# Altium project Light_Shield_V1.0.PrjPcb
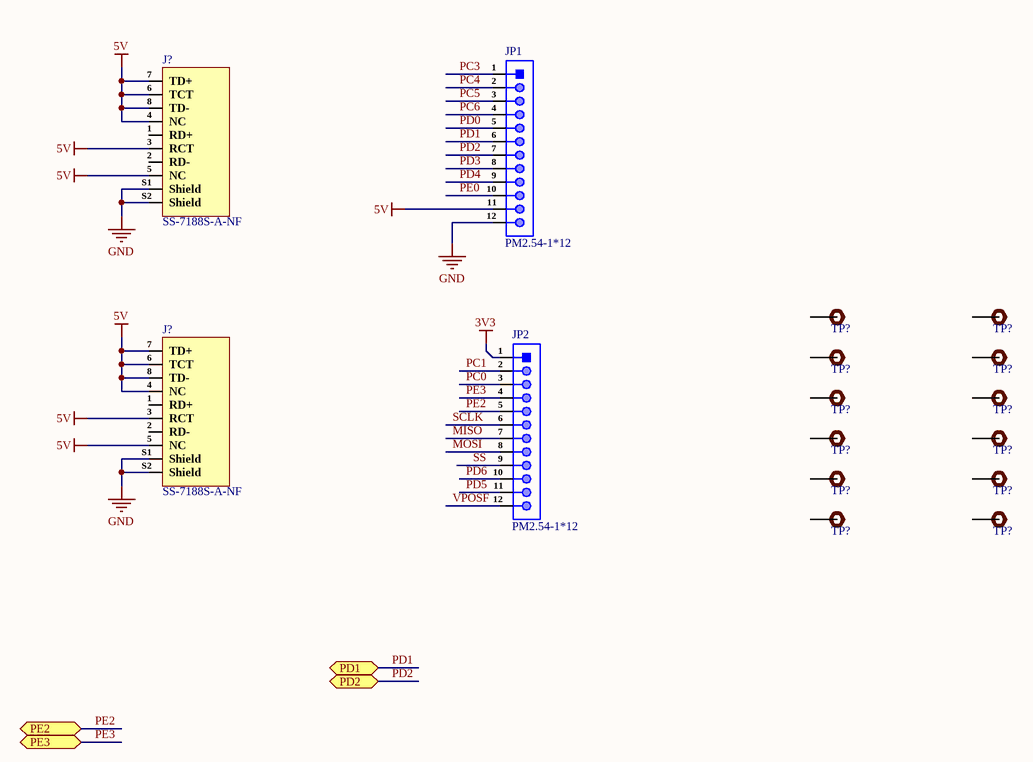
[diagram p0: Sheet1.SchDoc]
2 sheets, 22 parts. Net scope: flat (ports and power ports of the same name join across sheets).
Sheets:
  Sheet1.SchDoc
  Sheet2.SchDoc

## Sheet Sheet1.SchDoc
size A4; SheetNumber: 1; SheetTotal: 2

### Parts
(Parts that share a designator on the sheet are numbered #1, #2 ... from top to bottom, then left to right.)
J?#1  SS-7188S-A-NF  [SS-7188S-A-NF]
J?#2  SS-7188S-A-NF  [SS-7188S-A-NF]
JP1  PM2.54-1*12  [HDR 1x12 TH (Female)]
JP2  PM2.54-1*12  [HDR 1x12 TH (Female)]
TP?#1  TEST POINT  [Test-point]  (value not drawn)  (no BOM)
TP?#2  TEST POINT  [Test-point]  (value not drawn)  (no BOM)
TP?#3  TEST POINT  [Test-point]  (value not drawn)  (no BOM)
TP?#4  TEST POINT  [Test-point]  (value not drawn)  (no BOM)
TP?#5  TEST POINT  [Test-point]  (value not drawn)  (no BOM)
TP?#6  TEST POINT  [Test-point]  (value not drawn)  (no BOM)
TP?#7  TEST POINT  [Test-point]  (value not drawn)  (no BOM)
TP?#8  TEST POINT  [Test-point]  (value not drawn)  (no BOM)
TP?#9  TEST POINT  [Test-point]  (value not drawn)  (no BOM)
TP?#10  TEST POINT  [Test-point]  (value not drawn)  (no BOM)
TP?#11  TEST POINT  [Test-point]  (value not drawn)  (no BOM)
TP?#12  TEST POINT  [Test-point]  (value not drawn)  (no BOM)

### Ports
PD1 (bidir, see Sheet2[1D]), PD2 (bidir, see Sheet2[1D]), PE2 (bidir, see Sheet2[1D]), PE3 (bidir, see Sheet2[1D])

### Nets
3V3: JP2.1
5V: J?#1.3(RCT) J?#1.4(NC) J?#1.5(NC) J?#1.6(TCT) J?#1.7(TD+) J?#1.8(TD-) J?#2.3(RCT) J?#2.4(NC) J?#2.5(NC) J?#2.6(TCT) J?#2.7(TD+) J?#2.8(TD-) JP1.11
GND: J?#1.S1(Shield) J?#1.S2(Shield) J?#2.S1(Shield) J?#2.S2(Shield) JP1.12
MISO: JP2.7
MOSI: JP2.8
PC0: JP2.3
PC1: JP2.2
PC3: JP1.1
PC4: JP1.2
PC5: JP1.3
PC6: JP1.4
PD0: JP1.5
PD1: JP1.6 ; port PD1
PD2: JP1.7 ; port PD2
PD3: JP1.8
PD4: JP1.9
PD5: JP2.11
PD6: JP2.10
PE0: JP1.10
PE2: JP2.5 ; port PE2
PE3: JP2.4 ; port PE3
SCLK: JP2.6
SS: JP2.9
VPOSF: JP2.12

Not connected (* = marked no-connect by the designer): J?#1 1(RD+) 2(RD-); J?#2 1(RD+) 2(RD-); TP?#1 1; TP?#2 1; TP?#3 1; TP?#4 1; TP?#5 1; TP?#6 1; TP?#7 1; TP?#8 1; TP?#9 1; TP?#10 1; TP?#11 1; TP?#12 1

### Notes on the sheet
- File:
- Title:
- Date:
- Page
- Num:
- Total:
- Drawn By: Huzaifa Ali

### Library data of the parts
J?#1 J?#2 = SS-7188S-A-NF: CONN MOD JACK 8P8C R/A SHIELDED; Manufacturer: Bel; Item Type: Connectors; Supplier: Digikey; Supplier Part Number: 380-1047-ND; Manufacturer Part Number: SS-7188S-A-NF; RoHS: Yes; Stock: 8195; Pricing: 1=2.36, 10=2.058, 33=1.9703, 66=1.92652, 132=1.83894, 264=1.66379, 528=1.53242, 1023=1.31351, 2508=1.22594 (USD); Lead Free: 5698LeadFree; ComponentLink1URL: https://datasheet.ciiva.com/11726/0900766b8001c3e8-11726092.pdf?src-supplier=Rs; ComponentLink1Description: https://datasheet.ciiva.com/11726/0900766b8001c3e8-11726092.pdf?src-supplier=Rs; ComponentLink2URL: https://datasheet.ciiva.com/685/ct710001-685643.pdf?src-supplier=Digikey; ComponentLink2Description: https://datasheet.ciiva.com/685/ct710001-685643.pdf?src-supplier=Digikey; ComponentLink3URL: https://datasheet.ciiva.com/26934/getdatasheetpartid-781435-26934401.pdf?src-supplier=Verical; ComponentLink3Description: https://datasheet.ciiva.com/26934/getdatasheetpartid-781435-26934401.pdf?src-supplier=Verical; ComponentLink4URL: https://datasheet.ciiva.com/3138/ct710001-3138744.pdf?src-supplier=Avnet; ComponentLink4Description: https://datasheet.ciiva.com/3138/ct710001-3138744.pdf?src-supplier=Avnet; ComponentLink5URL: https://datasheet.ciiva.com/15170/getdatasheetpartid-79418-15170477.pdf?src-supplier=Verical; ComponentLink5Description: https://datasheet.ciiva.com/15170/getdatasheetpartid-79418-15170477.pdf?src-supplier=Verical
JP1 JP2 = PM2.54-1*12: 2.54mm 2.54mm Plugin 2.5A 12P -40℃~+105℃ Straight 1x12P Top 8.5mm Square Hole Plugin,P=2.54mm Female Headers ROHS; Manufacturer: ZHOURI; Manufacturer Part Number: PM2.54-1*12; Package: Plugin,P=2.54mm; LCSC Part Number: C5224029; Item Type: Female Header; ComponentLink1Description: LCSC; ComponentLink1URL: https://www.lcsc.com/product-detail/span-style-background-color-ff0-Female-span-Headers_ZHOURI-PM2-54-1-12_C5224029.html
TP?#1-TP?#12 = TEST POINT: Test Point ON; Item Type: TEST POINT

## Sheet Sheet2.SchDoc
size A4; SheetNumber: 2; SheetTotal: 2
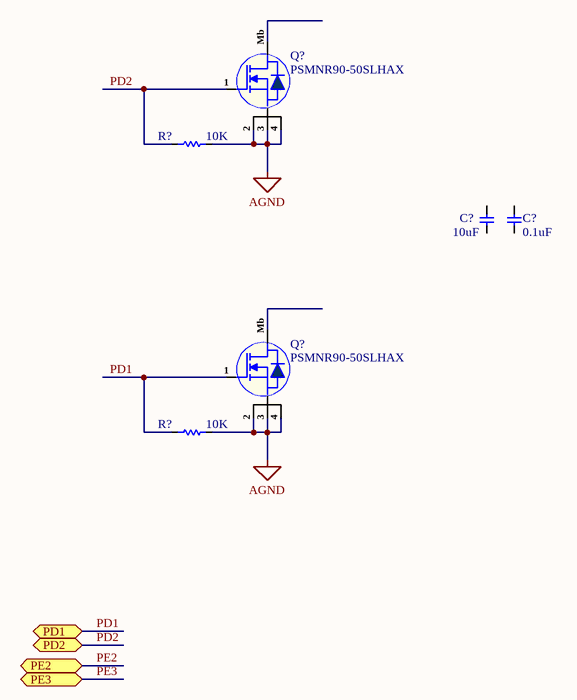
[diagram p1: Sheet2.SchDoc]

### Parts
(Parts that share a designator on the sheet are numbered #1, #2 ... from top to bottom, then left to right.)
C?#1  10uF  [Cap-0603]
C?#2  0.1uF  [Cap-0603]
Q?#1  PSMNR90-50SLHAX  [LFPAK88 (SOT1235)]
Q?#2  PSMNR90-50SLHAX  [LFPAK88 (SOT1235)]
R?#1  10K  [Res-0603]
R?#2  10K  [Res-0603]

### Ports
PD1 (bidir, see Sheet1[2C]), PD2 (bidir, see Sheet1[2D]), PE2 (bidir, see Sheet1[2D]), PE3 (bidir, see Sheet1[2D])

### Nets
AGND: Q?#1.2(S) Q?#1.3(S) Q?#1.4(S) Q?#2.2(S) Q?#2.3(S) Q?#2.4(S) R?#1.1 R?#2.1
PD1: Q?#2.1(G) R?#2.2 ; port PD1
PD2: Q?#1.1(G) R?#1.2 ; port PD2

Not connected (* = marked no-connect by the designer): C?#1 1 2; C?#2 1 2; Q?#1 Mb(D); Q?#2 Mb(D)

### Notes on the sheet
- File:
- Title:
- Date:
- Page
- Num:
- Total:
- Drawn By: Huzaifa Ali

### Library data of the parts
C?#1 = CL10A106MA8NRNC: CAP CER 10UF 25V X5R 0603; Manufacturer: Samsung; Tolerance: 20%; Supplier 1: Avnet; Manufacturer Part Number: CL10A106MA8NRNC; RoHS: Yes; Category: Ceramic Capacitors; Pricing 1: 4000=0.03753, 8000=0.03700, 16000=0.03595, 24000=0.03515, 32000=0.03383, 40000=0.03304, 400000=0.03225 (USD); Mount: Surface Mount; Case/Package: 0603; Case Code (Metric): 1608; Case Code (Imperial): 0603; Contact Plating: Tin; Min Operating Temperature: -55°C; Max Operating Temperature: 85°C; Package Quantity: 1; Packaging: Tape and Reel; Capacitance: 10uF; Voltage Rating: 25V; Dielectric: X5R; Termination: Wraparound; Series: CL; Construction: Flat; Length: 0.063inch; Width: 0.031inch; Thickness: 0.035inch; Lead Free: Lead Free; RoHS Compliant: Yes; ComponentLink1URL: https://datasheet.ciiva.com/25766/cl10a106ma8nrnc-25766562.pdf?src-supplier=Digi-Key; ComponentLink1Description: https://datasheet.ciiva.com/25766/cl10a106ma8nrnc-25766562.pdf?src-supplier=Digi-Key; Supplier Part Number 1: CL10A106MA8NRNC; LCSC Part Number: C96446
C?#2 = CL10B104KB8NNNC: CAP CER 0.1UF 50V X7R 0603; Manufacturer: Samsung; Material: Ceramic; Capacitance: 100nF; Tolerance: 10%; Supplier 1: Digi-Key; Manufacturer Part Number: CL10B104KB8NNNC; RoHS: Yes; Category: Ceramic Capacitors; Stock 1: 3998791; Pricing 1: 1=0.10000, 10=0.03000, 50=0.01640, 100=0.01340, 500=0.00954, 1000=0.00750 (USD); Mount: Surface Mount; Case/Package: 0603; Case Code (Metric): 1608; Case Code (Imperial): 0603; Contact Plating: Tin; Min Operating Temperature: -55°C; Max Operating Temperature: 125°C; Dielectric: X7R; Voltage Rating: 50V; Package Quantity: 1; Packaging: Tape and Reel; Voltage: 50V; Voltage Rating (DC): 50V; Series: CL; Construction: Flat; Length: 1.6mm; Width: 0.031inch; Height: 0.8mm; Depth: 0.8mm; Thickness: 0.035inch; Radiation Hardening: No; Lead Free: Lead Free; RoHS Compliant: Yes; ComponentLink1URL: https://datasheet.ciiva.com/25803/cl10b104kb8nnnc-25803393.pdf?src-supplier=Digi-Key; ComponentLink1Description: https://datasheet.ciiva.com/25803/cl10b104kb8nnnc-25803393.pdf?src-supplier=Digi-Key; ComponentLink2URL: https://datasheet.ciiva.com/26838/getdatasheetpartid-89097-26838411.pdf?src-supplier=Verical; ComponentLink2Description: https://datasheet.ciiva.com/26838/getdatasheetpartid-89097-26838411.pdf?src-supplier=Verical; ComponentLink3URL: https://datasheet.ciiva.com/29198/456651-da-01-en-vs-kondensator-0605-29198839.pdf?src-supplier=Conrad; ComponentLink3Description: https://datasheet.ciiva.com/29198/456651-da-01-en-vs-kondensator-0605-29198839.pdf?src-supplier=Conrad; Supplier Part Number 1: 1276-1000-1-ND; LCSC Part Number: C1591
Q?#1 Q?#2 = PSMNR90-50SLHAX: N-Channel 50 V 410A (Tc) 375W (Tc) Surface Mount LFPAK88 (SOT1235); Manufacturer: Nexperia; Item Type: Mosfet; Supplier: Digikey; Supplier Part Number: 1727-PSMNR90-50SLHAXCT-ND; Manufacturer Part Number: PSMNR90-50SLHAX; RoHS: No; Stock: 3956; Pricing: 1=5.86, 10=4.924, 100=3.9834, 500=3.54078, 1000=3.0318 (USD)
R?#1 R?#2 = RT0603BRD0710KL: RES SMD 10K OHM 0.1% 1/10W 0603; Manufacturer: Yageo; Power: 100mW; Rated Temperature: 70°C; Value: 10kR; Temperature Coefficient: 25ppm/°C; Working Voltage: 75V; Package Height: 0.45mm; Package Length: 1.6mm; Package Width: 0.8mm; Item Type: Resistor; Supplier 1: Rs; Manufacturer Part Number: RT0603BRD0710KL; RoHS: Yes; Category: Chip SMD Resistors; Stock 1: 20510; Pricing 1: 100=0.29800, 250=0.27800, 500=0.25900, 1000=0.23700 (GBP); Mounting Technology: Surface Mount; Pins: 2; Case/Package: 0603; Min Operating Temperature: -55°C; Max Operating Temperature: 155°C; Tolerance: 0.1%; Resistor Type: FIXED RESISTOR; Construction: Chip; Package Style: SMTMeter; Packaging: Tape and Reel; Technology: THIN FILM; Termination: Wraparound; Reach SVHC Compliant: Yes; RoHS Compliant: Yes; ComponentLink1URL: https://datasheet.ciiva.com:443/pdfs/VipMasterIC/IC/YAGO/YAGO-S-A0008510989/YAGO-S-A0008510989-1.pdf?src-supplier=IHS+Markit; ComponentLink1Description: https://datasheet.ciiva.com:443/pdfs/VipMasterIC/IC/YAGO/YAGO-S-A0008510989/YAGO-S-A0008510989-1.pdf?src-supplier=IHS+Markit; ComponentLink2URL: https://datasheet.ciiva.com/5624/pyu-rt-1-to-0-05-rohs-l-4-5624351.pdf?src-supplier=Mouser; ComponentLink2Description: https://datasheet.ciiva.com/5624/pyu-rt-1-to-0-05-rohs-l-4-5624351.pdf?src-supplier=Mouser; ComponentLink3URL: https://datasheet.ciiva.com/29721/pyu-rt-1-to-0-05-rohs-l-4-29721177.pdf?src-supplier=Digi-Key; ComponentLink3Description: https://datasheet.ciiva.com/29721/pyu-rt-1-to-0-05-rohs-l-4-29721177.pdf?src-supplier=Digi-Key; Supplier Part Number 1: 1991391P; LCSC Part Number: C95204

## Nets that join several sheets
PD1: Sheet1 (JP1.6), Sheet2 (Q?#2.1 R?#2.2)
PD2: Sheet1 (JP1.7), Sheet2 (Q?#1.1 R?#1.2)